# Altium project ETZ_BOARD_10.PrjPcb
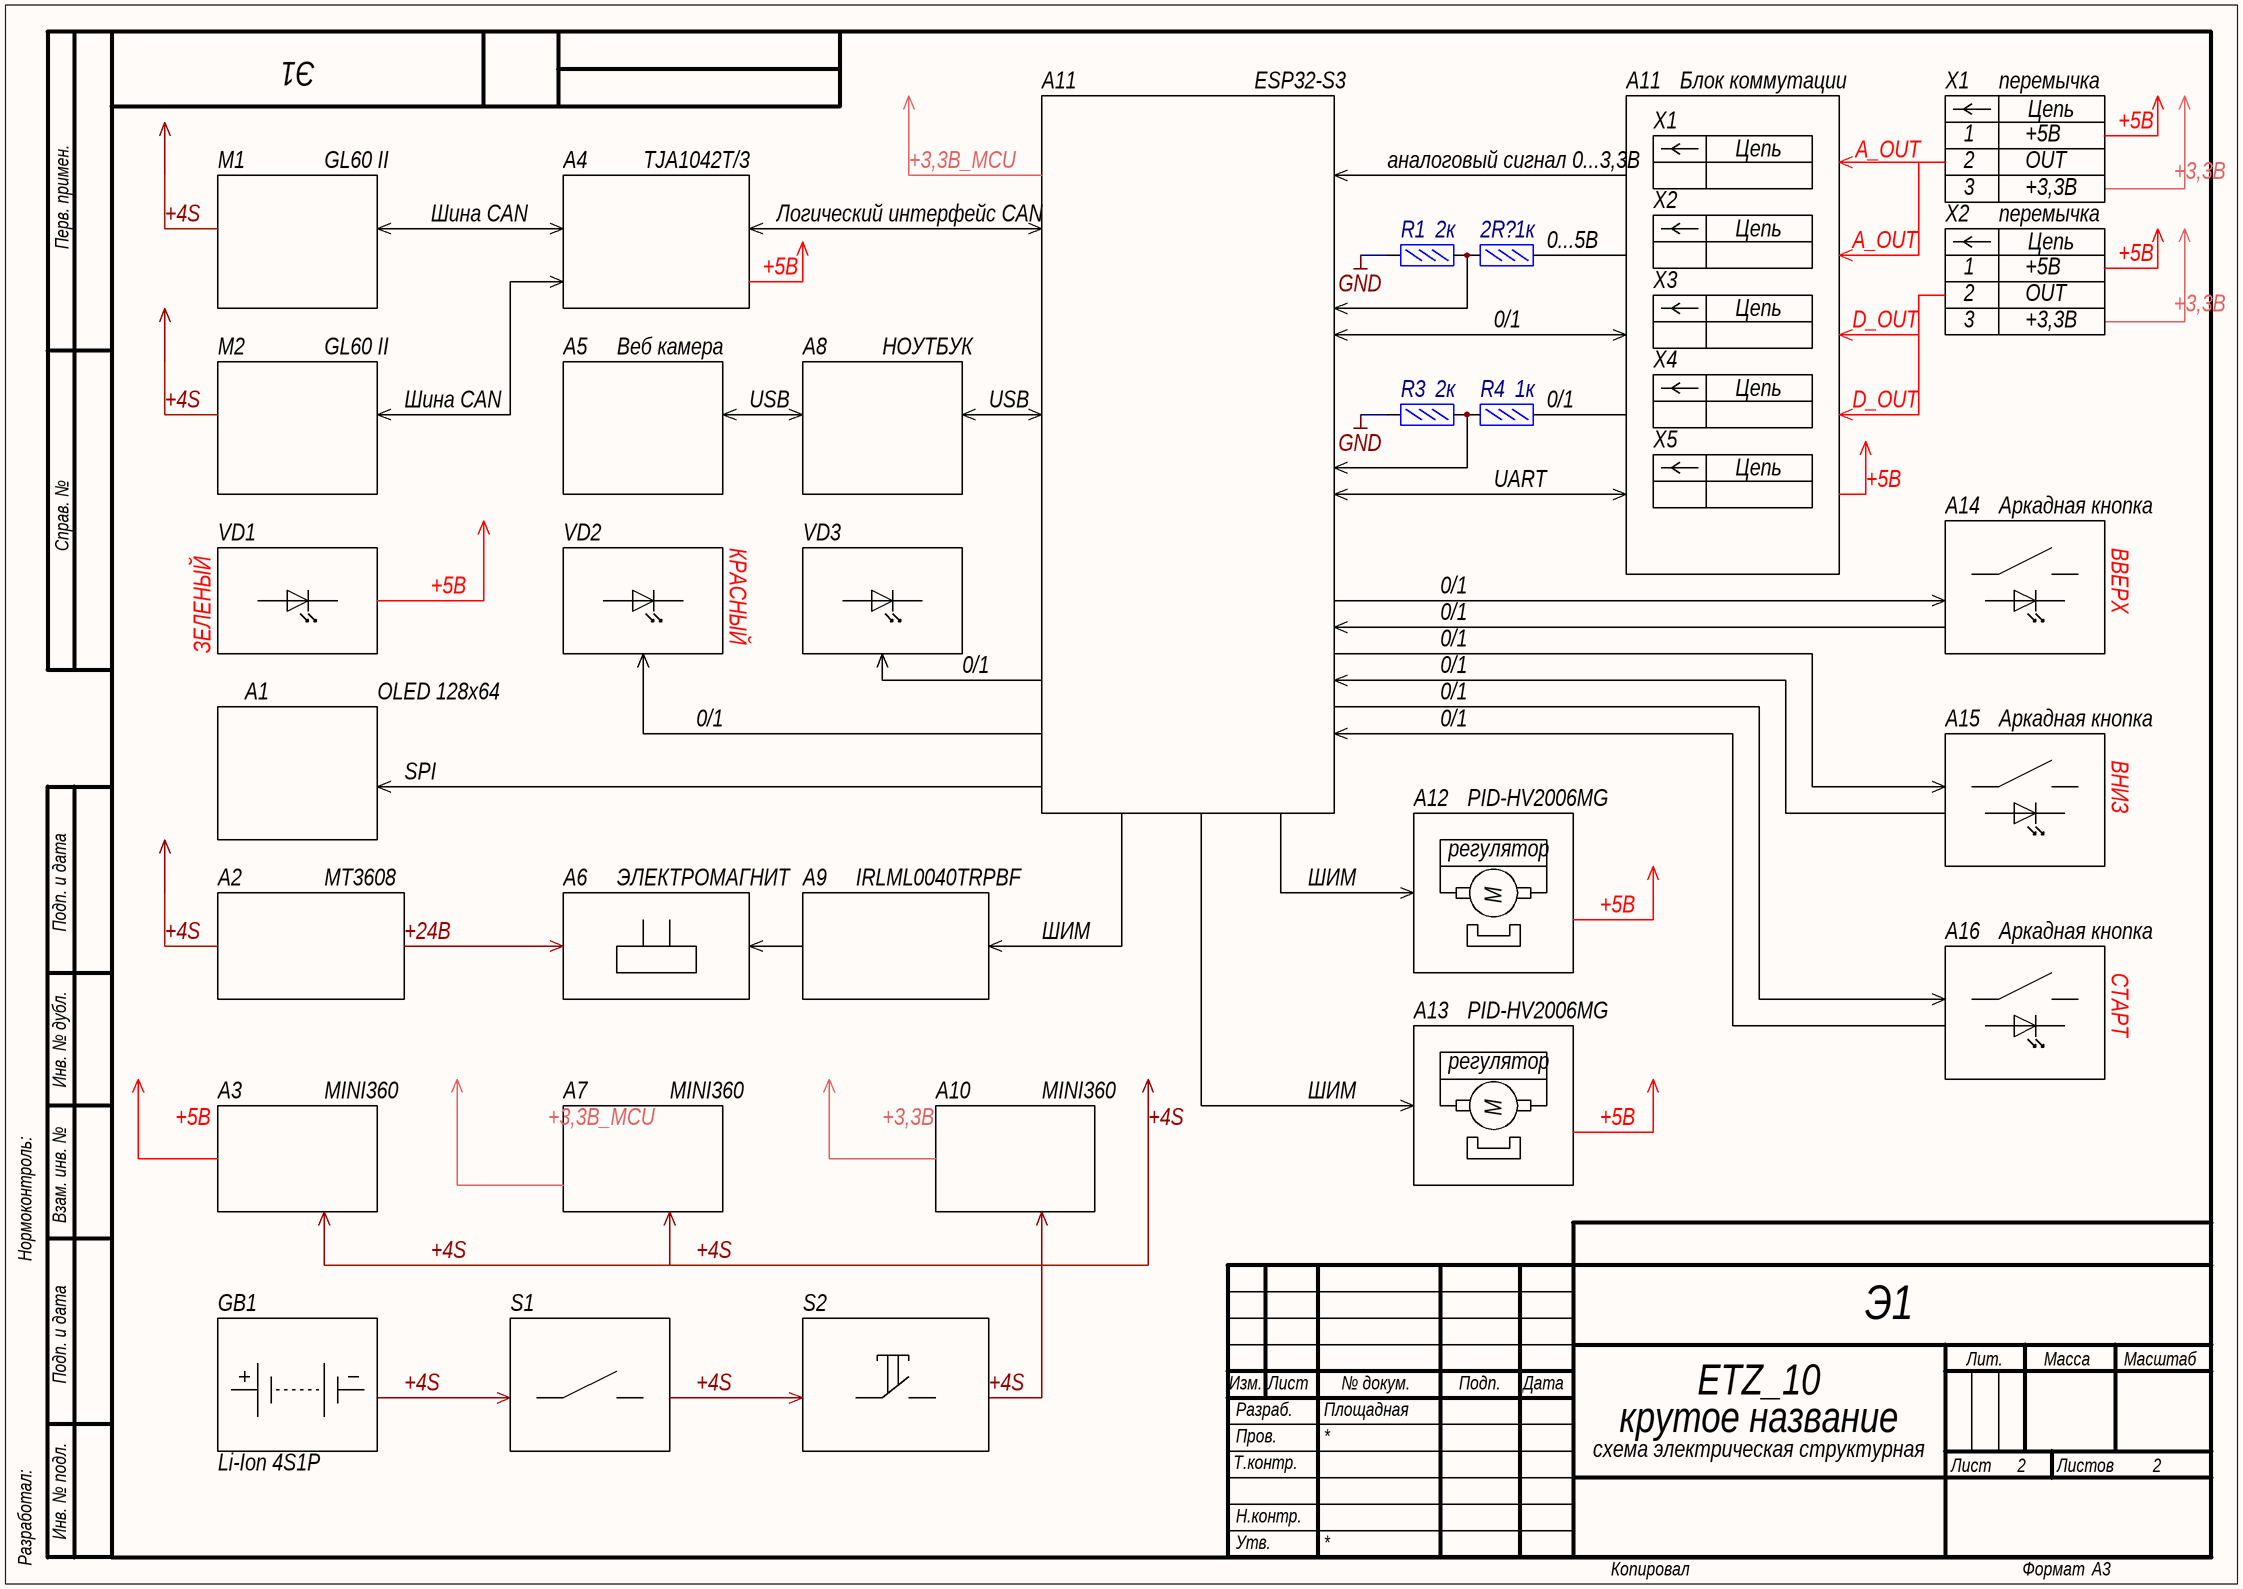
[diagram p0: Э1.SchDoc]
2 sheets, 6 parts. Net scope: global (net labels, ports and power ports of the same name join across sheets).
Board file: ETZ_BOARD_10.PcbDoc
Sheets:
  Э3.SchDoc
  Э1.SchDoc

## Sheet Э3.SchDoc: =title_line_1 + title_line_2
size 420 x 297 mm; SheetNumber: 1; SheetTotal: 2

### Notes on the sheet
- Перв. примен.
- Справ. №
- Подп. и дата
- Инв. № дубл.
- Нормоконтроль:
- Взам. инв. №
- Изм.
- Лист
- № докум.
- Подп.
- Дата
- Лит.
- Масса
- Масштаб
- Т.контр.
- Пров.
- Разраб.
- Листов
- Разработал:
- Инв. № подл.
- Н.контр.
- Утв.
- Копировал
- Формат
- А3

## Sheet Э1.SchDoc: =title_line_1 + title_line_2
size 420 x 297 mm; DrawnBy: Площадная; DocumentNumber: Э1; SheetNumber: 2; SheetTotal: 2; title_line_1: ETZ_10; title_line_2: крутое название; document_type: схема электрическая структурная

### Parts
(Parts that share a designator on the sheet are numbered #1, #2 ... from top to bottom, then left to right.)
2R?  1к  [R0603]
M?#1  мотор  [terminal-block]  (value not drawn)
M?#2  мотор  [terminal-block]  (value not drawn)
R1  2к  [R0603]
R3  2к  [R0603]
R4  1к  [R0603]

### Nets
GND: R1.2 R3.2
Net2R?_2: 2R?.2 R1.1
NetR3_1: R3.1 R4.2

Not connected (* = marked no-connect by the designer): 2R? 1; M?#1 1 2; M?#2 1 2; R4 1

### Notes on the sheet
- A11
- ESP32-S3
- Блок коммутации
- X1
- перемычка
- Цепь
- M1
- GL60 II
- A4
- TJA1042T/3
- +3,3В_MCU
- аналоговый сигнал 0...3,3В
- A_OUT
- 1
- 2
- +5В
- OUT
- +3,3В
- +4S
- Шина CAN
- Логический интерфейс CAN
- (near 2R?) 0...5В
- X2
- 3
- 0/1
- X3
- D_OUT
- M2
- A5
- Веб камера
- A8
- НОУТБУК
- X4
- USB
- (near R4) 0/1
- X5
- UART
- A14
- Аркадная кнопка
- VD1
- VD2
- КРАСНЫЙ
- VD3
- ВВЕРХ
- ЗЕЛЕНЫЙ
- A1
- OLED 128х64
- A15
- SPI
- ВНИЗ
- A12
- (near M?#1) регулятор
- PID-HV2006MG
- A2
- MT3608
- A6
- ЭЛЕКТРОМАГНИТ
- A9
- IRLML0040TRPBF
- ШИМ
- +24В
- A16
- СТАРТ
- A13
- (near M?#2) регулятор
- A3
- MINI360
- A7
- A10
- GB1
- S1
- S2
- Li-Ion 4S1P
- Перв. примен.
- Справ. №
- Подп. и дата
- Инв. № дубл.
- Нормоконтроль:
- Взам. инв. №
- Изм.
- Лист
- № докум.
- Подп.
- Дата
- Лит.
- Масса
- Масштаб
- Т.контр.
- Пров.
- Разраб.
- Листов
- Разработал:
- Инв. № подл.
- Н.контр.
- Утв.
- Копировал
- Формат
- А3
- (in symbol MOTOR) M

### Library data of the parts
2R? R4 = RC0603FR-071KL: Резистор 1кОм 0,063Вт 1%; Manufacturer: YAGEO; Name: RC0603FR-071KL; Tolerance: 1%; Value: 1к
M?#1 M?#2 = MOTOR: nam: мотор
R1 R3 = RC0603FR-072KL: Резистор 2кОм 0,063Вт 1%; Manufacturer: YAGEO; Name: RC0603FR-072KL; Tolerance: 1%; Value: 2к